# Altium schematic sheet Schematic_sheet.SchDoc
size A4; SheetNumber: 1; SheetTotal: 1
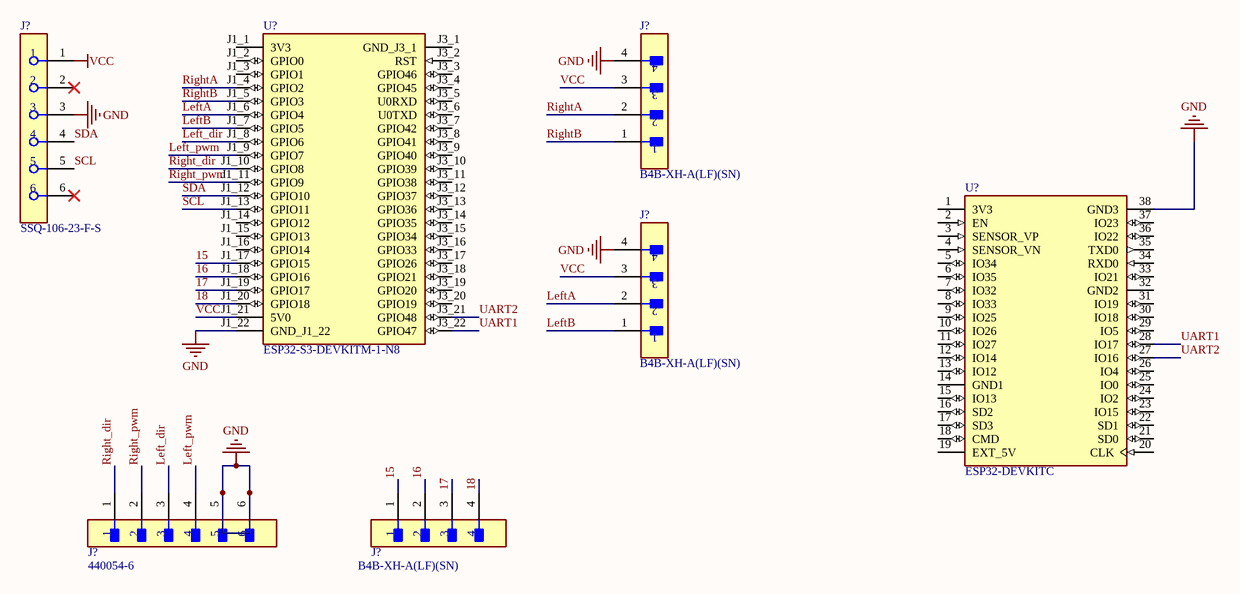
[diagram p0: Schematic_sheet.SchDoc]

## Parts
(Parts that share a designator on the sheet are numbered #1, #2 ... from top to bottom, then left to right.)
J?#1  SSQ-106-23-F-S  [FP-SSQ-106-23-F-S-MFG]
J?#2  B4B-XH-A(LF)(SN)  [FP-B4B-XH-A_LF_SN-MFG]
J?#3  B4B-XH-A(LF)(SN)  [FP-B4B-XH-A_LF_SN-MFG]
J?#4  440054-6  [FP-440054-6-MFG]
J?#5  B4B-XH-A(LF)(SN)  [FP-B4B-XH-A_LF_SN-MFG]
U?#1  ESP32-S3-DEVKITM-1-N8  [MODULE_ESP32-S3-DEVKITM-1-N8]
U?#2  ESP32-DEVKITC  [MODULE_ESP32-DEVKITC]

## Nets
GND: J?#1.3 J?#2.4 J?#3.4 J?#4.5 J?#4.6 U?#1.J1_22(GND_J1_22) U?#2.38(GND3)
VCC: J?#1.1 J?#2.3 J?#3.3 U?#1.J1_21(5V0)
15: J?#5.1 U?#1.J1_17(GPIO15)
16: J?#5.2 U?#1.J1_18(GPIO16)
17: J?#5.3 U?#1.J1_19(GPIO17)
18: J?#5.4 U?#1.J1_20(GPIO18)
Left_dir: J?#4.3 U?#1.J1_8(GPIO6)
Left_pwm: J?#4.4 U?#1.J1_9(GPIO7)
LeftA: J?#3.2 U?#1.J1_6(GPIO4)
LeftB: J?#3.1 U?#1.J1_7(GPIO5)
Right_dir: J?#4.1 U?#1.J1_10(GPIO8)
Right_pwm: J?#4.2 U?#1.J1_11(GPIO9)
RightA: J?#2.2 U?#1.J1_4(GPIO2)
RightB: J?#2.1 U?#1.J1_5(GPIO3)
SCL: J?#1.5 U?#1.J1_13(GPIO11)
SDA: J?#1.4 U?#1.J1_12(GPIO10)
UART1: U?#1.J3_22(GPIO47) U?#2.28(IO17)
UART2: U?#1.J3_21(GPIO48) U?#2.27(IO16)

Not connected (* = marked no-connect by the designer): J?#1 2* 6*; U?#1 J1_1(3V3) J1_2(GPIO0) J1_3(GPIO1) J1_14(GPIO12) J1_15(GPIO13) J1_16(GPIO14) J3_1(GND_J3_1) J3_2(RST) J3_3(GPIO46) J3_4(GPIO45) J3_5(U0RXD) J3_6(U0TXD) J3_7(GPIO42) J3_8(GPIO41) J3_9(GPIO40) J3_10(GPIO39) J3_11(GPIO38) J3_12(GPIO37) J3_13(GPIO36) J3_14(GPIO35) J3_15(GPIO34) J3_16(GPIO33) J3_17(GPIO26) J3_18(GPIO21) J3_19(GPIO20) J3_20(GPIO19); U?#2 1(3V3) 2(EN) 3(SENSOR_VP) 4(SENSOR_VN) 5(IO34) 6(IO35) 7(IO32) 8(IO33) 9(IO25) 10(IO26) 11(IO27) 12(IO14) 13(IO12) 14(GND1) 15(IO13) 16(SD2) 17(SD3) 18(CMD) 19(EXT_5V) 20(CLK) 21(SD0) 22(SD1) 23(IO15) 24(IO2) 25(IO0) 26(IO4) 29(IO5) 30(IO18) 31(IO19) 32(GND2) 33(IO21) 34(RXD0) 35(TXD0) 36(IO22) 37(IO23)

## Library data of the parts
J?#1 = CMP-02766-000556-1: CONN RCPT 6POS 0.1 GOLD PCB; Pitch: 2.54mm; Number of Contacts: 6; Gender: Receptacle; REACH SVHC: No SVHC; Lead Free: Lead Free; Packaging: Bulk; Termination: Solder; Contact Plating: Gold; Radiation Hardening: No; Mount: Through Hole; Number of Rows: 1; Contact Material: Bronze
J?#2 J?#3 J?#5 = CMP-17439-000250-1: CONN HEADER VERT 4POS 2.5MM; Number of Contacts: 4; Contact Resistance: 20mR; Voltage Rating: 250V; Max Current Rating: 3A; Gender: Male; Wire/Cable Gauge: 22AWG; Mated Stacking Heights: 9.8mm; Insulation Resistance: 1GR; Orientation: Straight; Contact Type: Male Pin; Contact Finish - Mating: TIN; Series: XH; Max Voltage Rating (AC): 250V; Lead Pitch: 2.5mm; Contact Shape: Square; Insulation Color: Natural; Termination: Solder; Lead Free: Lead Free; Voltage Rating (AC): 250V; Number of Rows: 1; Flammability Rating: UL94 V-0; Number of Positions: 4; Max Operating Temperature: 85°C; Package Quantity: 500; Mount: Through Hole; REACH SVHC: No SVHC; Connector Type: Header; Insulation Material: Nylon; Fastening Type: Detent; Min Operating Temperature: -25°C; Housing Color: White; Packaging: Bulk; Contact Plating: Tin; Contact Material: Brass; Max Voltage Rating (DC): 250V; Housing Material: Polyamide; Color: Natural; Material: Polyamide; Pitch: 2.5mm; Depth: 5.75mm; Current Rating: 3A; Length: 12.4mm
J?#4 = CMP-03369-000041-1: CONN HEADER VERT 6POS 2MM; Manufacturer: TE Connectivity; Number Of Contacts: 6; Conn Gender: Male; Conn Orientation: Vertical; Current Rating: 3A; Voltage Rating: 250V; Lead Free: Yes; Pitch: 2mm; Category: Conn; Device Class L2: Headers and Wire Housings; Footprint Url: https://www.te.com/commerce/DocumentDelivery/DDEController?Action=showdoc&DocId=Customer+Drawing%7F440054%7FF6%7Fpdf%7FEnglish%7FENG_CD_440054_F6.pdf%7F440054-6; Mouser Description: Headers & Wire Housings 6 POS HDR VERT 2.0mm; Device Class L3: unset; Automotive: No; ComponentLink2Description: Datasheet; Contact Material: Tin,Nickel; Temperature Range High: +85°C; RoHS: TRUE; Number Of Rows: 1; Temperature Range Low: -25°C; Temperature: -25°C to +85°C; Height: 6.35mm; Manufacturer Part Number: 440054-6; Octopart: https://octopart.com/440054-6-te+connectivity-40327311; Device Class L1: Connectors; Digikey Description: CONN HEADER VERT 6POS 2MM; ComponentLink2URL: https://www.te.com/usa-en/product-440054-6.datasheet.pdf; Package: 440054-6
U?#1 = ESP32-S3-DEVKITM-1-N8: MF: {'manufacturer': u'Espressif Systems'}; Package: None; Price: None; Value: *; MP: ESP32-S3-DEVKITM-1-N8; Availability: Unavailable
U?#2 = ESP32-DEVKITC: ESP32-WROOM-32UE series Transceiver; 802.11 b/g/n (Wi-Fi, WiFi, WLAN), Bluetooth Â® Smart Ready 4.x Dual Mode Evaluation Board; MF: Espressif Systems; SnapEDA_Link: https://www.snapeda.com/parts/ESP32-DEVKITC/Espressif+Systems/view-part/?ref=snap; Package: None; Value: *; MP: ESP32-DEVKITC; Check_prices: https://www.snapeda.com/parts/ESP32-DEVKITC/Espressif+Systems/view-part/?ref=eda